# Altium schematic sheet Soc_SmartFusion2.SchDoc
size A1; SheetNumber: 2; SheetTotal: 9
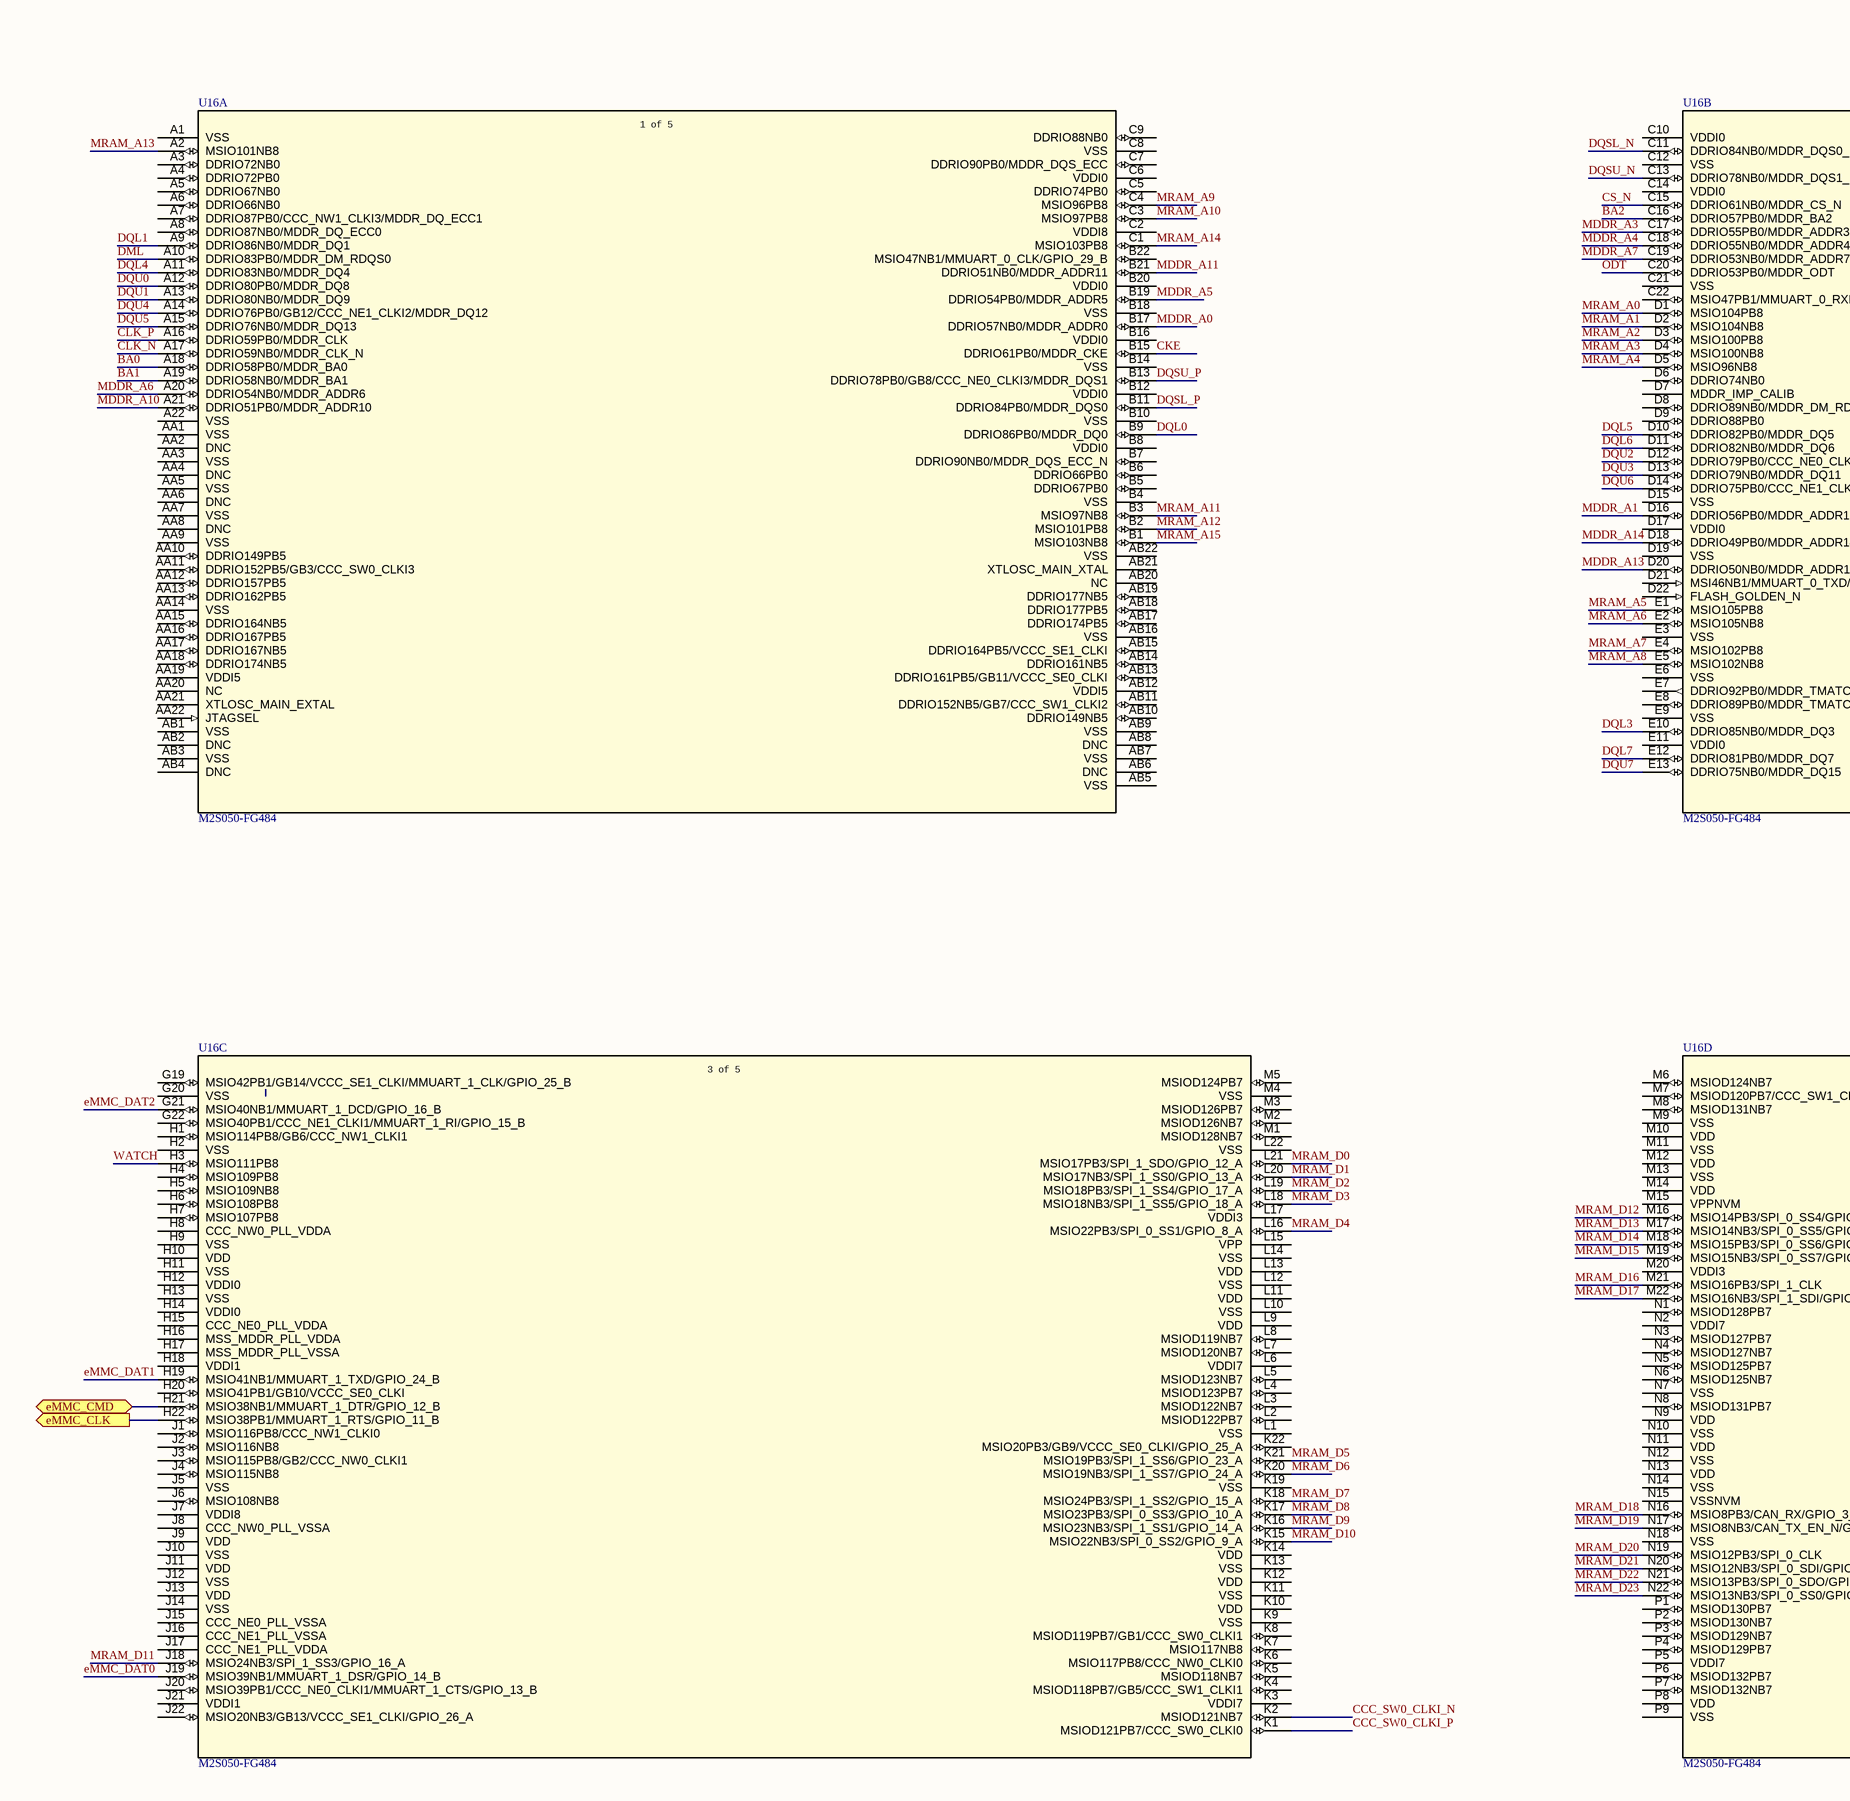
[diagram p0: Soc_SmartFusion2.SchDoc, top left]
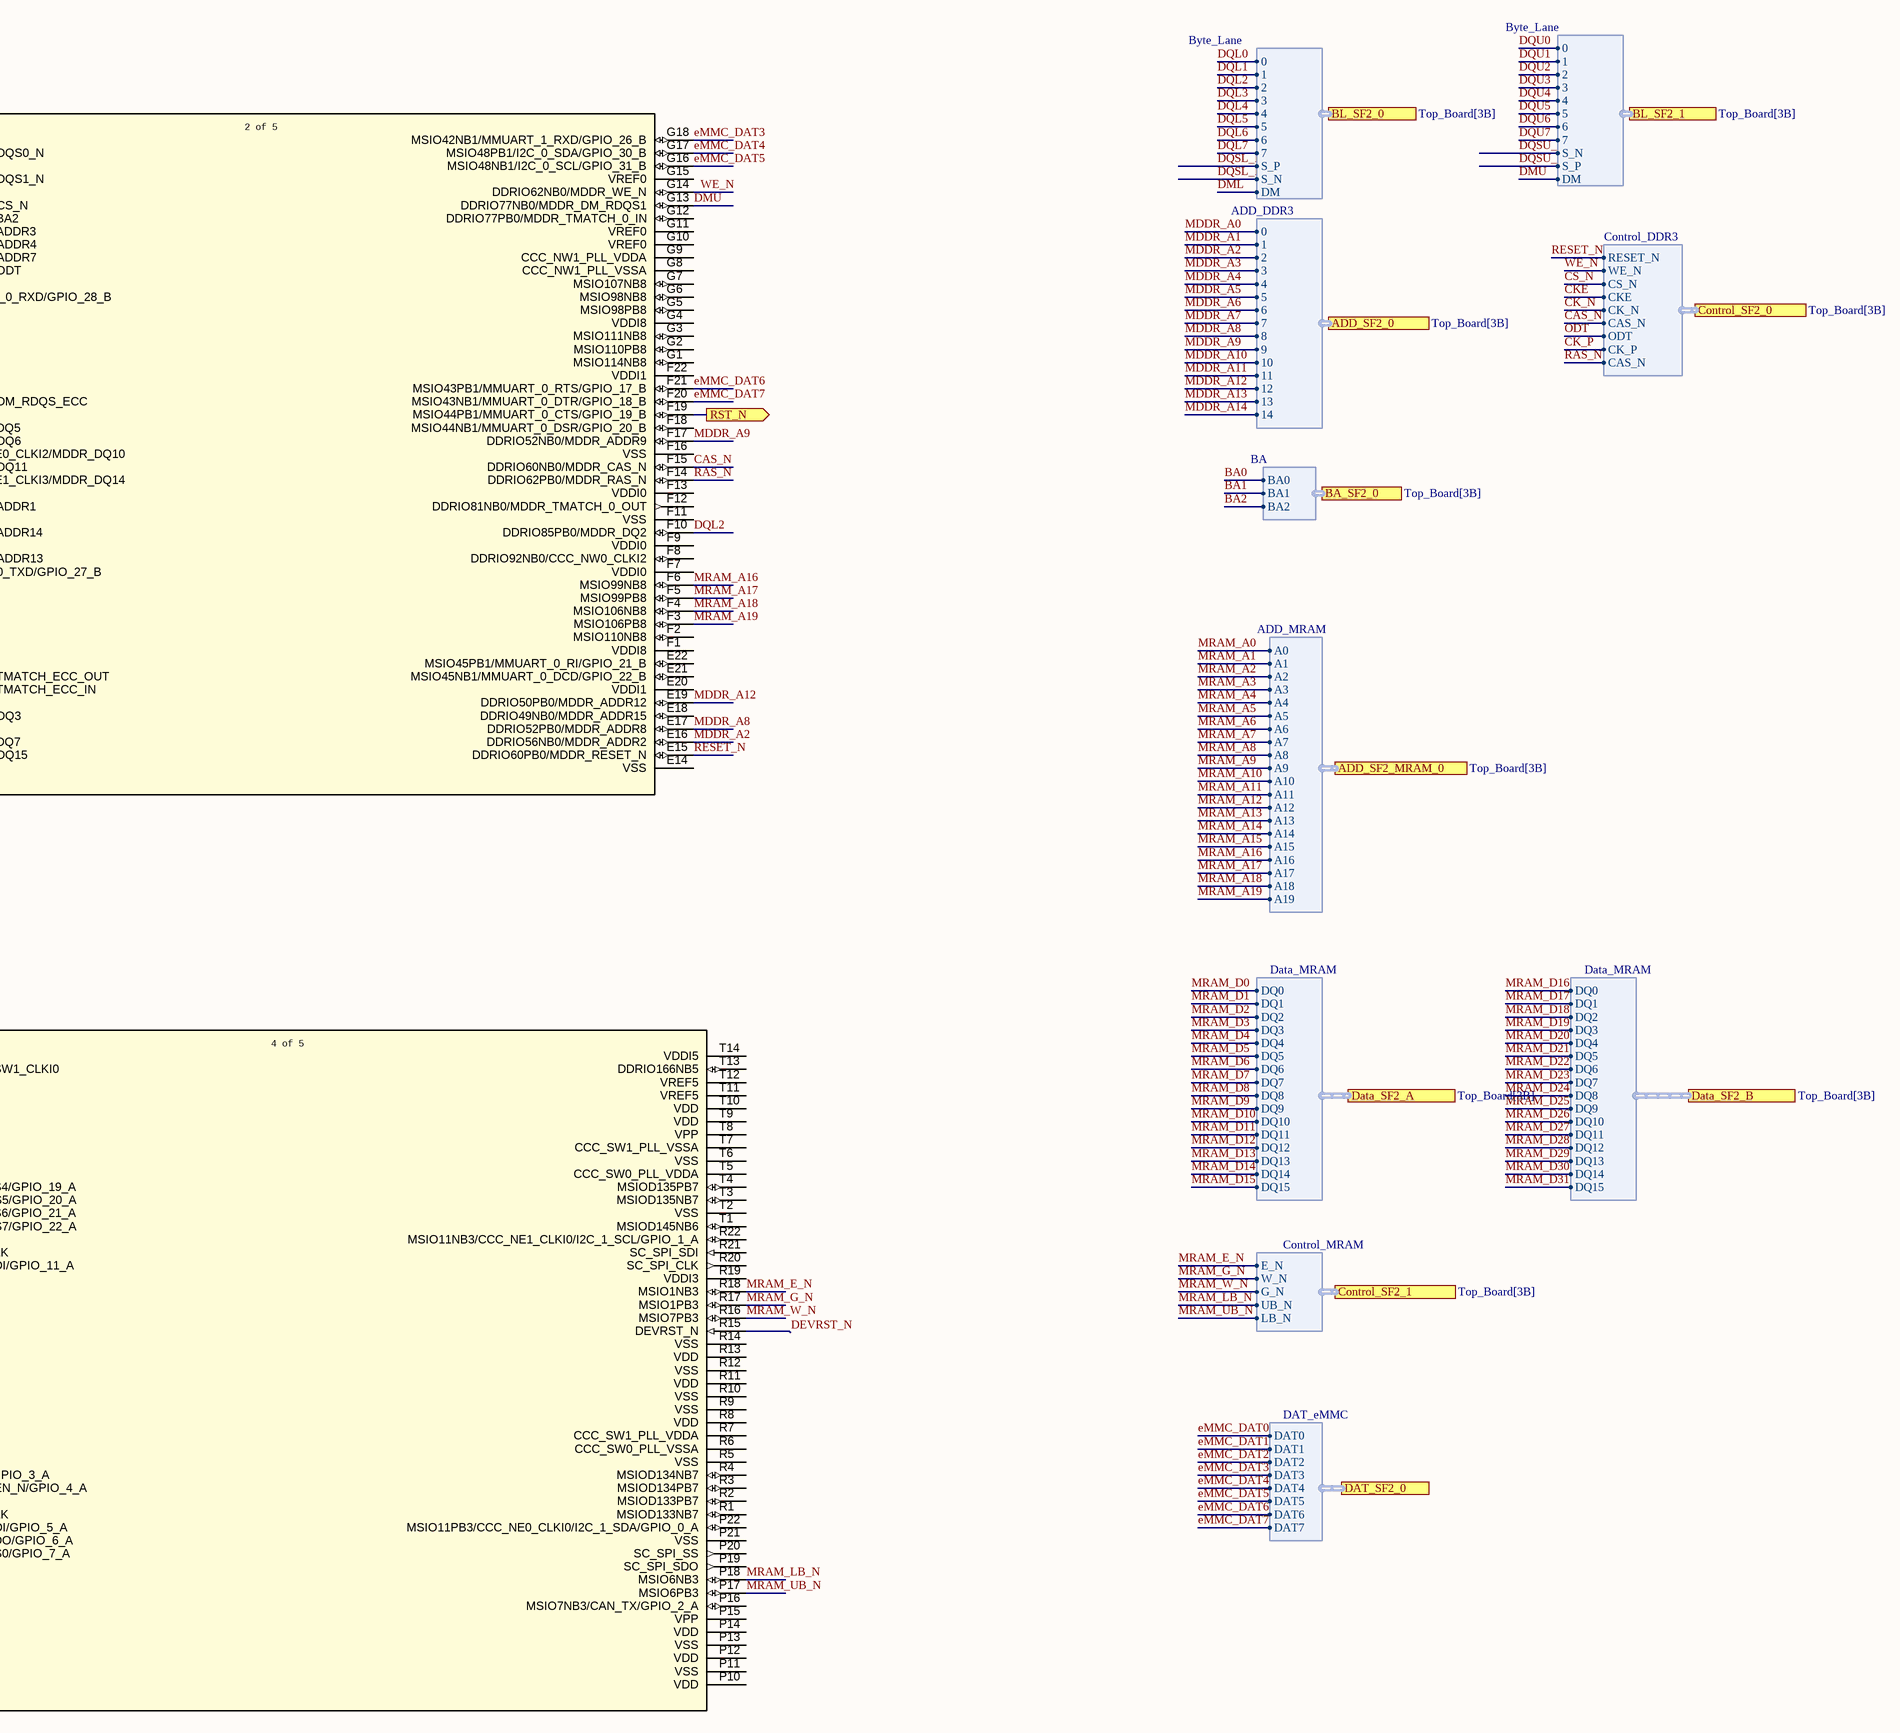
[diagram p1: Soc_SmartFusion2.SchDoc, top right]
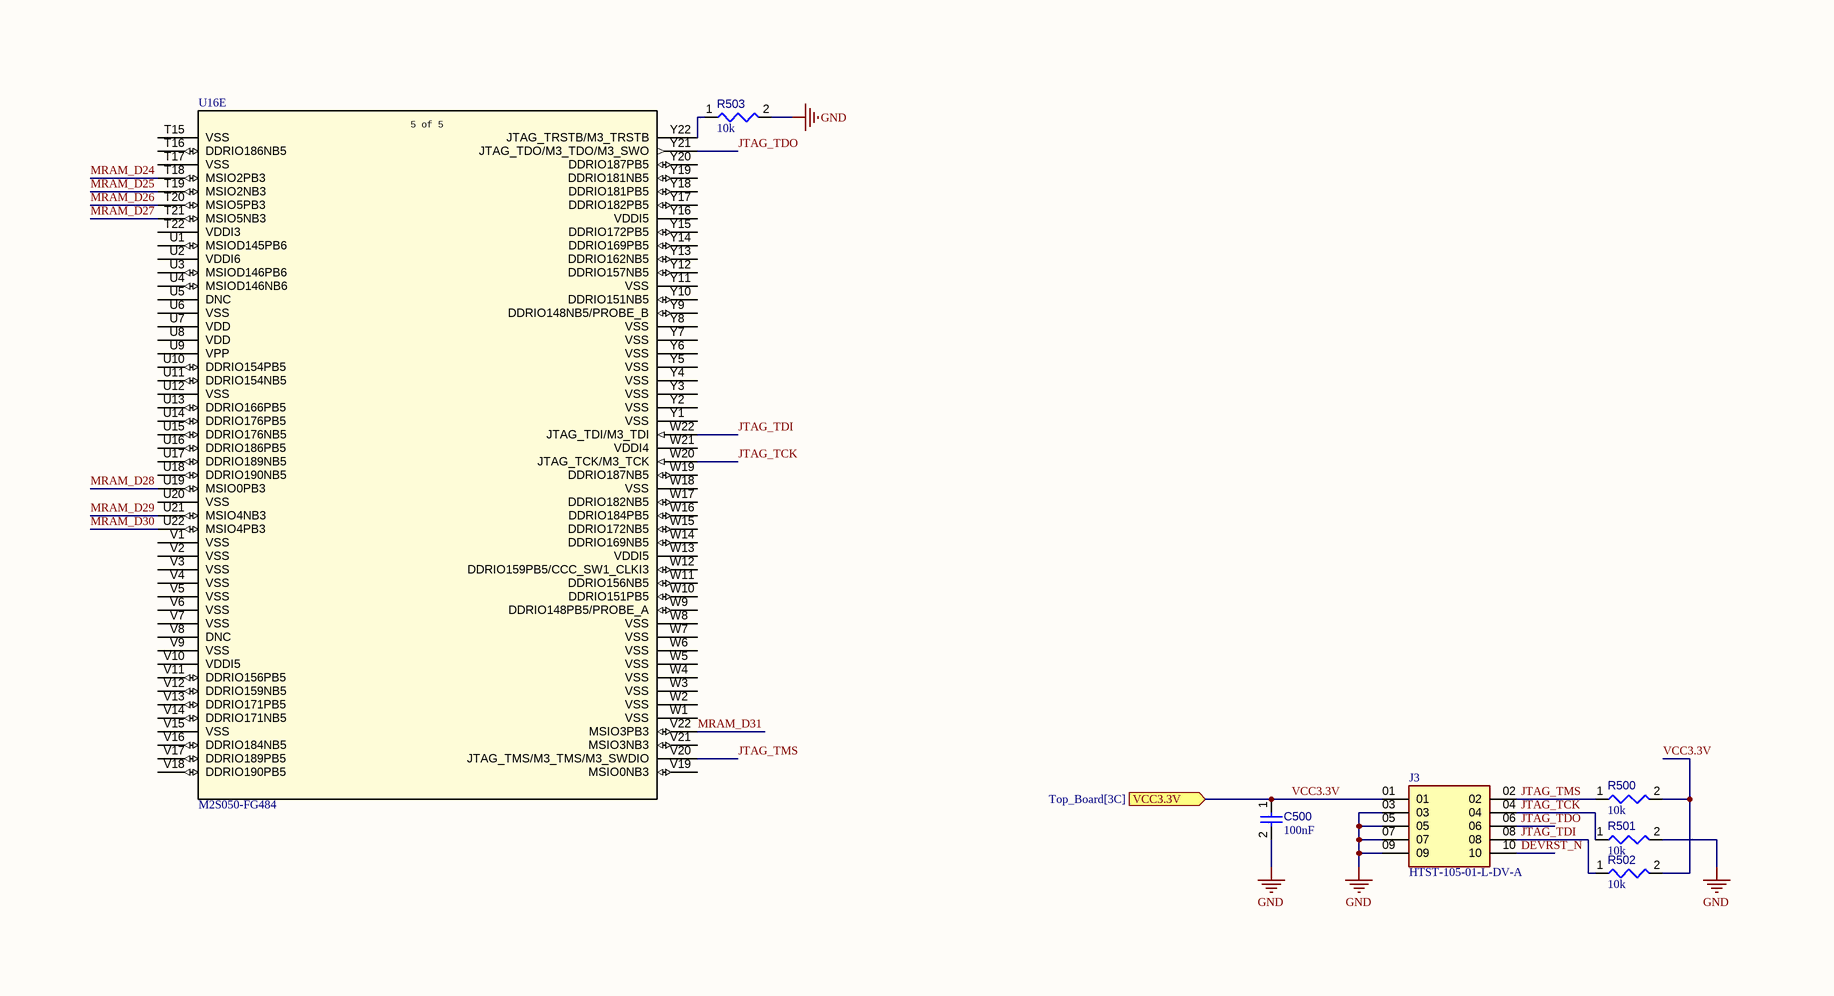
[diagram p2: Soc_SmartFusion2.SchDoc, bottom left]
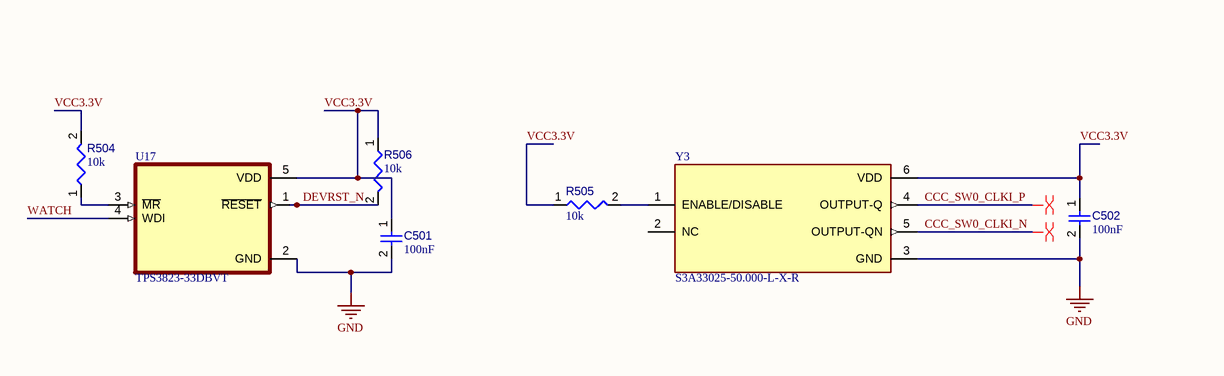
[diagram p3: Soc_SmartFusion2.SchDoc, bottom right]

## Parts
C500  value 100nF  [CAPC1608X90X40NL10T20]  (hidden comment: Capacitor 100 nF +/-10% 50 V 0603)
C501  value 100nF  [CAPC1608X90X40NL10T20]  (hidden comment: Capacitor 100 nF +/-10% 50 V 0603)
C502  value 100nF  [CAPC1608X90X40NL10T20]  (hidden comment: Capacitor 100 nF +/-10% 50 V 0603)
J3  HTST-105-01-L-DV-A  [SAMTEC_HTST-105-01-L-DV-A]
R500  value 10k  [RESC1608X55X25ML10T15]  (hidden comment: Resistor 10k +/-1% 0603 100 mW)
R501  value 10k  [RESC1608X55X25ML10T15]  (hidden comment: Resistor 10k +/-1% 0603 100 mW)
R502  value 10k  [RESC1608X55X25ML10T15]  (hidden comment: Resistor 10k +/-1% 0603 100 mW)
R503  value 10k  [RESC1608X55X25ML10T15]  (hidden comment: Resistor 10k +/-1% 0603 100 mW)
R504  value 10k  [RESC1608X55X25ML10T15]  (hidden comment: Resistor 10k +/-1% 0603 100 mW)
R505  value 10k  [RESC1608X55X25ML10T15]  (hidden comment: Resistor 10k +/-1% 0603 100 mW)
R506  value 10k  [RESC1608X55X25ML10T15]  (hidden comment: Resistor 10k +/-1% 0603 100 mW)
U16  M2S050-FG484  [FG484_MS-034_VAR_AAJ-1_MCH]  (parts A,B,C,D,E of 5)
U17  TPS3823-33DBVT  [SOT95P280X145-5N]
Y3  S3A33025-50.000-L-X-R  [OSC_S3A33025-50.000-L-X-R]

## Ports
ADD_SF2_0 (harness ADD_DDR3, see Top_Board[3B]), ADD_SF2_MRAM_0 (harness ADD_MRAM, see Top_Board[3B]), BA_SF2_0 (harness BA, see Top_Board[3B]), BL_SF2_0 (harness Byte_Lane, see Top_Board[3B]), BL_SF2_1 (harness Byte_Lane, see Top_Board[3B]), Control_SF2_0 (harness Control_DDR3, see Top_Board[3B]), Control_SF2_1 (harness Control_MRAM, see Top_Board[3B]), DAT_SF2_0 (harness DAT_eMMC), Data_SF2_A (harness Data_MRAM, see Top_Board[3B]), Data_SF2_B (harness Data_MRAM, see Top_Board[3B]), eMMC_CLK (out), eMMC_CMD (bidir), RST_N (out), VCC3.3V (in, see Top_Board[3C])

## Harnesses
Byte_Lane: 0, 2, 3, 4, 7, 1, 6, S_P, S_N, 5, DM
Byte_Lane: 0, 1, 2, 3, 4, 5, 6, 7, S_N, S_P, DM
ADD_DDR3: 1, 2, 3, 4, 6, 5, 7, 8, 9, 11, 10, 12, 13, 0, 14
BA: BA0, BA1, BA2
Control_DDR3: RESET_N, WE_N, CS_N, CKE, CK_N, CAS_N, ODT, CK_P, CAS_N
ADD_MRAM: A0, A1, A2, A3, A4, A5, A6, A7, A8, A9, A10, A11, A12, A13, A14, A15, A16, A17, A18, A19
Data_MRAM: DQ0, DQ1, DQ2, DQ3, DQ4, DQ5, DQ6, DQ7, DQ8, DQ9, DQ10, DQ11, DQ12, DQ13, DQ14, DQ15
Control_MRAM: E_N, W_N, G_N, LB_N, UB_N
DAT_eMMC: DAT0, DAT1, DAT2, DAT3, DAT5, DAT6, DAT7, DAT4

## Nets
GND: C500.2 C501.2 C502.2 J3.03 J3.05 J3.07 J3.09 R501.2 R503.2 U17.2(GND) Y3.3(GND)
BA0: U16.A18(DDRIO58PB0/MDDR_BA0) ; port BA_SF2_0.BA0
BA1: U16.A19(DDRIO58NB0/MDDR_BA1) ; port BA_SF2_0.BA1
BA2: U16.C16(DDRIO57PB0/MDDR_BA2) ; port BA_SF2_0.BA2
CAS_N: U16.F14(DDRIO62PB0/MDDR_RAS_N) U16.F15(DDRIO60NB0/MDDR_CAS_N) ; port Control_SF2_0.CAS_N  [also labelled RAS_N]
CCC_SW0_CLKI_N: U16.K2(MSIOD121NB7) Y3.5(OUTPUT-QN)
CCC_SW0_CLKI_P: U16.K1(MSIOD121PB7/CCC_SW0_CLKI0) Y3.4(OUTPUT-Q)
CK_N: port Control_SF2_0.CK_N
CK_P: port Control_SF2_0.CK_P
CKE: U16.B15(DDRIO61PB0/MDDR_CKE) ; port Control_SF2_0.CKE
CLK_N: U16.A17(DDRIO59NB0/MDDR_CLK_N)
CLK_P: U16.A16(DDRIO59PB0/MDDR_CLK)
CS_N: U16.C15(DDRIO61NB0/MDDR_CS_N) ; port Control_SF2_0.CS_N
DEVRST_N: J3.10 R506.2 U16.R15(DEVRST_N) U17.1(~{RESET})
DML: U16.A10(DDRIO83PB0/MDDR_DM_RDQS0) ; port BL_SF2_0.DM
DMU: U16.G13(DDRIO77NB0/MDDR_DM_RDQS1) ; port BL_SF2_1.DM
DQL0: U16.B9(DDRIO86PB0/MDDR_DQ0) ; port BL_SF2_0.0
DQL1: U16.A9(DDRIO86NB0/MDDR_DQ1) ; port BL_SF2_0.1
DQL2: U16.F10(DDRIO85PB0/MDDR_DQ2) ; port BL_SF2_0.2
DQL3: U16.E10(DDRIO85NB0/MDDR_DQ3) ; port BL_SF2_0.3
DQL4: U16.A11(DDRIO83NB0/MDDR_DQ4) ; port BL_SF2_0.4
DQL5: U16.D10(DDRIO82PB0/MDDR_DQ5) ; port BL_SF2_0.5
DQL6: U16.D11(DDRIO82NB0/MDDR_DQ6) ; port BL_SF2_0.6
DQL7: U16.E12(DDRIO81PB0/MDDR_DQ7) ; port BL_SF2_0.7
DQSL_N: U16.C11(DDRIO84NB0/MDDR_DQS0_N) ; port BL_SF2_0.S_N
DQSL_P: U16.B11(DDRIO84PB0/MDDR_DQS0) ; port BL_SF2_0.S_P
DQSU_N: U16.C13(DDRIO78NB0/MDDR_DQS1_N) ; port BL_SF2_1.S_P
DQSU_P: U16.B13(DDRIO78PB0/GB8/CCC_NE0_CLKI3/MDDR_DQS1) ; port BL_SF2_1.S_N
DQU0: U16.A12(DDRIO80PB0/MDDR_DQ8) ; port BL_SF2_1.0
DQU1: U16.A13(DDRIO80NB0/MDDR_DQ9) ; port BL_SF2_1.1
DQU2: U16.D12(DDRIO79PB0/CCC_NE0_CLKI2/MDDR_DQ10) ; port BL_SF2_1.2
DQU3: U16.D13(DDRIO79NB0/MDDR_DQ11) ; port BL_SF2_1.3
DQU4: U16.A14(DDRIO76PB0/GB12/CCC_NE1_CLKI2/MDDR_DQ12) ; port BL_SF2_1.4
DQU5: U16.A15(DDRIO76NB0/MDDR_DQ13) ; port BL_SF2_1.5
DQU6: U16.D14(DDRIO75PB0/CCC_NE1_CLKI3/MDDR_DQ14) ; port BL_SF2_1.6
DQU7: U16.E13(DDRIO75NB0/MDDR_DQ15) ; port BL_SF2_1.7
eMMC_CLK: U16.H22(MSIO38PB1/MMUART_1_RTS/GPIO_11_B) ; port eMMC_CLK
eMMC_CMD: U16.H21(MSIO38NB1/MMUART_1_DTR/GPIO_12_B) ; port eMMC_CMD
eMMC_DAT0: U16.J19(MSIO39NB1/MMUART_1_DSR/GPIO_14_B) ; port DAT_SF2_0.DAT0
eMMC_DAT1: U16.H19(MSIO41NB1/MMUART_1_TXD/GPIO_24_B) ; port DAT_SF2_0.DAT1
eMMC_DAT2: U16.G21(MSIO40NB1/MMUART_1_DCD/GPIO_16_B) ; port DAT_SF2_0.DAT2
eMMC_DAT3: U16.G18(MSIO42NB1/MMUART_1_RXD/GPIO_26_B) ; port DAT_SF2_0.DAT3
eMMC_DAT4: U16.G17(MSIO48PB1/I2C_0_SDA/GPIO_30_B) ; port DAT_SF2_0.DAT4
eMMC_DAT5: U16.G16(MSIO48NB1/I2C_0_SCL/GPIO_31_B) ; port DAT_SF2_0.DAT5
eMMC_DAT6: U16.F21(MSIO43PB1/MMUART_0_RTS/GPIO_17_B) ; port DAT_SF2_0.DAT6
eMMC_DAT7: U16.F20(MSIO43NB1/MMUART_0_DTR/GPIO_18_B) ; port DAT_SF2_0.DAT7
JTAG_TCK: J3.04 R501.1 U16.W20(JTAG_TCK/M3_TCK)
JTAG_TDI: J3.08 R502.1 U16.W22(JTAG_TDI/M3_TDI)
JTAG_TDO: J3.06 U16.Y21(JTAG_TDO/M3_TDO/M3_SWO)
JTAG_TMS: J3.02 R500.1 U16.V20(JTAG_TMS/M3_TMS/M3_SWDIO)
MDDR_A0: U16.B17(DDRIO57NB0/MDDR_ADDR0) ; port ADD_SF2_0.0
MDDR_A1: U16.D16(DDRIO56PB0/MDDR_ADDR1) ; port ADD_SF2_0.1
MDDR_A2: U16.E16(DDRIO56NB0/MDDR_ADDR2) ; port ADD_SF2_0.2
MDDR_A3: U16.C17(DDRIO55PB0/MDDR_ADDR3) ; port ADD_SF2_0.3
MDDR_A4: U16.C18(DDRIO55NB0/MDDR_ADDR4) ; port ADD_SF2_0.4
MDDR_A5: U16.B19(DDRIO54PB0/MDDR_ADDR5) ; port ADD_SF2_0.5
MDDR_A6: U16.A20(DDRIO54NB0/MDDR_ADDR6) ; port ADD_SF2_0.6
MDDR_A7: U16.C19(DDRIO53NB0/MDDR_ADDR7) ; port ADD_SF2_0.7
MDDR_A8: U16.E17(DDRIO52PB0/MDDR_ADDR8) ; port ADD_SF2_0.8
MDDR_A9: U16.F17(DDRIO52NB0/MDDR_ADDR9) ; port ADD_SF2_0.9
MDDR_A10: U16.A21(DDRIO51PB0/MDDR_ADDR10) ; port ADD_SF2_0.10
MDDR_A11: U16.B21(DDRIO51NB0/MDDR_ADDR11) ; port ADD_SF2_0.11
MDDR_A12: U16.E19(DDRIO50PB0/MDDR_ADDR12) ; port ADD_SF2_0.12
MDDR_A13: U16.D20(DDRIO50NB0/MDDR_ADDR13) ; port ADD_SF2_0.13
MDDR_A14: U16.D18(DDRIO49PB0/MDDR_ADDR14) ; port ADD_SF2_0.14
MRAM_A0: U16.D1(MSIO104PB8) ; port ADD_SF2_MRAM_0.A0
MRAM_A1: U16.D2(MSIO104NB8) ; port ADD_SF2_MRAM_0.A1
MRAM_A2: U16.D3(MSIO100PB8) ; port ADD_SF2_MRAM_0.A2
MRAM_A3: U16.D4(MSIO100NB8) ; port ADD_SF2_MRAM_0.A3
MRAM_A4: U16.D5(MSIO96NB8) ; port ADD_SF2_MRAM_0.A4
MRAM_A5: U16.E1(MSIO105PB8) ; port ADD_SF2_MRAM_0.A5
MRAM_A6: U16.E2(MSIO105NB8) ; port ADD_SF2_MRAM_0.A6
MRAM_A7: U16.E4(MSIO102PB8) ; port ADD_SF2_MRAM_0.A7
MRAM_A8: U16.E5(MSIO102NB8) ; port ADD_SF2_MRAM_0.A8
MRAM_A9: U16.C4(MSIO96PB8) ; port ADD_SF2_MRAM_0.A9
MRAM_A10: U16.C3(MSIO97PB8) ; port ADD_SF2_MRAM_0.A10
MRAM_A11: U16.B3(MSIO97NB8) ; port ADD_SF2_MRAM_0.A11
MRAM_A12: U16.B2(MSIO101PB8) ; port ADD_SF2_MRAM_0.A12
MRAM_A13: U16.A2(MSIO101NB8) ; port ADD_SF2_MRAM_0.A13
MRAM_A14: U16.C1(MSIO103PB8) ; port ADD_SF2_MRAM_0.A14
MRAM_A15: U16.B1(MSIO103NB8) ; port ADD_SF2_MRAM_0.A15
MRAM_A16: U16.F6(MSIO99NB8) ; port ADD_SF2_MRAM_0.A16
MRAM_A17: U16.F5(MSIO99PB8) ; port ADD_SF2_MRAM_0.A17
MRAM_A18: U16.F4(MSIO106NB8) ; port ADD_SF2_MRAM_0.A18
MRAM_A19: U16.F3(MSIO106PB8) ; port ADD_SF2_MRAM_0.A19
MRAM_D0: U16.L21(MSIO17PB3/SPI_1_SDO/GPIO_12_A) ; port Data_SF2_A.DQ0
MRAM_D1: U16.L20(MSIO17NB3/SPI_1_SS0/GPIO_13_A) ; port Data_SF2_A.DQ1
MRAM_D2: U16.L19(MSIO18PB3/SPI_1_SS4/GPIO_17_A) ; port Data_SF2_A.DQ2
MRAM_D3: U16.L18(MSIO18NB3/SPI_1_SS5/GPIO_18_A) ; port Data_SF2_A.DQ3
MRAM_D4: U16.L16(MSIO22PB3/SPI_0_SS1/GPIO_8_A) ; port Data_SF2_A.DQ4
MRAM_D5: U16.K21(MSIO19PB3/SPI_1_SS6/GPIO_23_A) ; port Data_SF2_A.DQ5
MRAM_D6: U16.K20(MSIO19NB3/SPI_1_SS7/GPIO_24_A) ; port Data_SF2_A.DQ6
MRAM_D7: U16.K18(MSIO24PB3/SPI_1_SS2/GPIO_15_A) ; port Data_SF2_A.DQ7
MRAM_D8: U16.K17(MSIO23PB3/SPI_0_SS3/GPIO_10_A) ; port Data_SF2_A.DQ8
MRAM_D9: U16.K16(MSIO23NB3/SPI_1_SS1/GPIO_14_A) ; port Data_SF2_A.DQ9
MRAM_D10: U16.K15(MSIO22NB3/SPI_0_SS2/GPIO_9_A) ; port Data_SF2_A.DQ10
MRAM_D11: U16.J18(MSIO24NB3/SPI_1_SS3/GPIO_16_A) ; port Data_SF2_A.DQ11
MRAM_D12: U16.M16(MSIO14PB3/SPI_0_SS4/GPIO_19_A) ; port Data_SF2_A.DQ12
MRAM_D13: U16.M17(MSIO14NB3/SPI_0_SS5/GPIO_20_A) ; port Data_SF2_A.DQ13
MRAM_D14: U16.M18(MSIO15PB3/SPI_0_SS6/GPIO_21_A) ; port Data_SF2_A.DQ14
MRAM_D15: U16.M19(MSIO15NB3/SPI_0_SS7/GPIO_22_A) ; port Data_SF2_A.DQ15
MRAM_D16: U16.M21(MSIO16PB3/SPI_1_CLK) ; port Data_SF2_B.DQ0
MRAM_D17: U16.M22(MSIO16NB3/SPI_1_SDI/GPIO_11_A) ; port Data_SF2_B.DQ1
MRAM_D18: U16.N16(MSIO8PB3/CAN_RX/GPIO_3_A) ; port Data_SF2_B.DQ2
MRAM_D19: U16.N17(MSIO8NB3/CAN_TX_EN_N/GPIO_4_A) ; port Data_SF2_B.DQ3
MRAM_D20: U16.N19(MSIO12PB3/SPI_0_CLK) ; port Data_SF2_B.DQ4
MRAM_D21: U16.N20(MSIO12NB3/SPI_0_SDI/GPIO_5_A) ; port Data_SF2_B.DQ5
MRAM_D22: U16.N21(MSIO13PB3/SPI_0_SDO/GPIO_6_A) ; port Data_SF2_B.DQ6
MRAM_D23: U16.N22(MSIO13NB3/SPI_0_SS0/GPIO_7_A) ; port Data_SF2_B.DQ7
MRAM_D24: U16.T18(MSIO2PB3) ; port Data_SF2_B.DQ8
MRAM_D25: U16.T19(MSIO2NB3) ; port Data_SF2_B.DQ9
MRAM_D26: U16.T20(MSIO5PB3) ; port Data_SF2_B.DQ10
MRAM_D27: U16.T21(MSIO5NB3) ; port Data_SF2_B.DQ11
MRAM_D28: U16.U19(MSIO0PB3) ; port Data_SF2_B.DQ12
MRAM_D29: U16.U21(MSIO4NB3) ; port Data_SF2_B.DQ13
MRAM_D30: U16.U22(MSIO4PB3) ; port Data_SF2_B.DQ14
MRAM_D31: U16.V22(MSIO3PB3) ; port Data_SF2_B.DQ15
MRAM_E_N: U16.R18(MSIO1NB3) ; port Control_SF2_1.E_N
MRAM_G_N: U16.R17(MSIO1PB3) ; port Control_SF2_1.W_N
MRAM_LB_N: U16.P18(MSIO6NB3) ; port Control_SF2_1.UB_N
MRAM_UB_N: U16.P17(MSIO6PB3) ; port Control_SF2_1.LB_N
MRAM_W_N: U16.R16(MSIO7PB3) ; port Control_SF2_1.G_N
ODT: U16.C20(DDRIO53PB0/MDDR_ODT) ; port Control_SF2_0.ODT
RESET_N: U16.E15(DDRIO60PB0/MDDR_RESET_N) ; port Control_SF2_0.RESET_N
RST_N: U16.F19(MSIO44PB1/MMUART_0_CTS/GPIO_19_B) ; port RST_N
VCC3.3V: C500.1 C501.1 C502.1 J3.01 R500.2 R502.2 R504.2 R505.1 R506.1 U17.5(VDD) Y3.6(VDD) ; port VCC3.3V
WATCH: U16.H3(MSIO111PB8) U17.4(WDI)
WE_N: U16.G14(DDRIO62NB0/MDDR_WE_N) ; port Control_SF2_0.WE_N
NetR503_1: R503.1 U16.Y22(JTAG_TRSTB/M3_TRSTB)
NetR504_1: R504.1 U17.3(~{MR})
NetR505_2: R505.2 Y3.1(ENABLE/DISABLE)

Not connected (* = marked no-connect by the designer): U16 A1(VSS) A3(DDRIO72NB0) A4(DDRIO72PB0) A5(DDRIO67NB0) A6(DDRIO66NB0) A7(DDRIO87PB0/CCC_NW1_CLKI3/MDDR_DQ_ECC1) A8(DDRIO87NB0/MDDR_DQ_ECC0) A22(VSS) AA1(VSS) AA2(DNC) AA3(VSS) AA4(DNC) AA5(VSS) AA6(DNC) AA7(VSS) AA8(DNC) AA9(VSS) AA10(DDRIO149PB5) AA11(DDRIO152PB5/GB3/CCC_SW0_CLKI3) AA12(DDRIO157PB5) AA13(DDRIO162PB5) AA14(VSS) AA15(DDRIO164NB5) AA16(DDRIO167PB5) AA17(DDRIO167NB5) AA18(DDRIO174NB5) AA19(VDDI5) AA20(NC) AA21(XTLOSC_MAIN_EXTAL) AA22(JTAGSEL) AB1(VSS) AB2(DNC) AB3(VSS) AB4(DNC) AB5(VSS) AB6(DNC) AB7(VSS) AB8(DNC) AB9(VSS) AB10(DDRIO149NB5) AB11(DDRIO152NB5/GB7/CCC_SW1_CLKI2) AB12(VDDI5) AB13(DDRIO161PB5/GB11/VCCC_SE0_CLKI) AB14(DDRIO161NB5) AB15(DDRIO164PB5/VCCC_SE1_CLKI) AB16(VSS) AB17(DDRIO174PB5) AB18(DDRIO177PB5) AB19(DDRIO177NB5) AB20(NC) AB21(XTLOSC_MAIN_XTAL) AB22(VSS) B4(VSS) B5(DDRIO67PB0) B6(DDRIO66PB0) B7(DDRIO90NB0/MDDR_DQS_ECC_N) B8(VDDI0) B10(VSS) B12(VDDI0) B14(VSS) B16(VDDI0) B18(VSS) B20(VDDI0) B22(MSIO47NB1/MMUART_0_CLK/GPIO_29_B) C2(VDDI8) C5(DDRIO74PB0) C6(VDDI0) C7(DDRIO90PB0/MDDR_DQS_ECC) C8(VSS) C9(DDRIO88NB0) C10(VDDI0) C12(VSS) C14(VDDI0) C21(VSS) C22(MSIO47PB1/MMUART_0_RXD/GPIO_28_B) D6(DDRIO74NB0) D7(MDDR_IMP_CALIB) D8(DDRIO89NB0/MDDR_DM_RDQS_ECC) D9(DDRIO88PB0) D15(VSS) D17(VDDI0) D19(VSS) D21(MSI46NB1/MMUART_0_TXD/GPIO_27_B) D22(FLASH_GOLDEN_N) E3(VSS) E6(VSS) E7(DDRIO92PB0/MDDR_TMATCH_ECC_OUT) E8(DDRIO89PB0/MDDR_TMATCH_ECC_IN) E9(VSS) E11(VDDI0) E14(VSS) E18(DDRIO49NB0/MDDR_ADDR15) E20(VDDI1) E21(MSIO45NB1/MMUART_0_DCD/GPIO_22_B) E22(MSIO45PB1/MMUART_0_RI/GPIO_21_B) F1(VDDI8) F2(MSIO110NB8) F7(VDDI0) F8(DDRIO92NB0/CCC_NW0_CLKI2) F9(VDDI0) F11(VSS) F12(DDRIO81NB0/MDDR_TMATCH_0_OUT) F13(VDDI0) F16(VSS) F18(MSIO44NB1/MMUART_0_DSR/GPIO_20_B) F22(VDDI1) G1(MSIO114NB8) G2(MSIO110PB8) G3(MSIO111NB8) G4(VDDI8) G5(MSIO98PB8) G6(MSIO98NB8) G7(MSIO107NB8) G8(CCC_NW1_PLL_VSSA) G9(CCC_NW1_PLL_VDDA) G10(VREF0) G11(VREF0) G12(DDRIO77PB0/MDDR_TMATCH_0_IN) G15(VREF0) G19(MSIO42PB1/GB14/VCCC_SE1_CLKI/MMUART_1_CLK/GPIO_25_B) G20(VSS) G22(MSIO40PB1/CCC_NE1_CLKI1/MMUART_1_RI/GPIO_15_B) H1(MSIO114PB8/GB6/CCC_NW1_CLKI1) H2(VSS) H4(MSIO109PB8) H5(MSIO109NB8) H6(MSIO108PB8) H7(MSIO107PB8) H8(CCC_NW0_PLL_VDDA) H9(VSS) H10(VDD) H11(VSS) H12(VDDI0) H13(VSS) H14(VDDI0) H15(CCC_NE0_PLL_VDDA) H16(MSS_MDDR_PLL_VDDA) H17(MSS_MDDR_PLL_VSSA) H18(VDDI1) H20(MSIO41PB1/GB10/VCCC_SE0_CLKI) J1(MSIO116PB8/CCC_NW1_CLKI0) J2(MSIO116NB8) J3(MSIO115PB8/GB2/CCC_NW0_CLKI1) J4(MSIO115NB8) J5(VSS) J6(MSIO108NB8) J7(VDDI8) J8(CCC_NW0_PLL_VSSA) J9(VDD) J10(VSS) J11(VDD) J12(VSS) J13(VDD) J14(VSS) J15(CCC_NE0_PLL_VSSA) J16(CCC_NE1_PLL_VSSA) J17(CCC_NE1_PLL_VDDA) J20(MSIO39PB1/CCC_NE0_CLKI1/MMUART_1_CTS/GPIO_13_B) J21(VDDI1) J22(MSIO20NB3/GB13/VCCC_SE1_CLKI/GPIO_26_A) K3(VDDI7) K4(MSIOD118PB7/GB5/CCC_SW1_CLKI1) K5(MSIOD118NB7) K6(MSIO117PB8/CCC_NW0_CLKI0) K7(MSIO117NB8) K8(MSIOD119PB7/GB1/CCC_SW0_CLKI1) K9(VSS) K10(VDD) K11(VSS) K12(VDD) K13(VSS) K14(VDD) K19(VSS) K22(MSIO20PB3/GB9/VCCC_SE0_CLKI/GPIO_25_A) L1(VSS) L2(MSIOD122PB7) L3(MSIOD122NB7) L4(MSIOD123PB7) L5(MSIOD123NB7) L6(VDDI7) L7(MSIOD120NB7) L8(MSIOD119NB7) L9(VDD) L10(VSS) L11(VDD) L12(VSS) L13(VDD) L14(VSS) L15(VPP) L17(VDDI3) L22(VSS) M1(MSIOD128NB7) M2(MSIOD126NB7) M3(MSIOD126PB7) M4(VSS) M5(MSIOD124PB7) M6(MSIOD124NB7) M7(MSIOD120PB7/CCC_SW1_CLKI0) M8(MSIOD131NB7) M9(VSS) M10(VDD) M11(VSS) M12(VDD) M13(VSS) M14(VDD) M15(VPPNVM) M20(VDDI3) N1(MSIOD128PB7) N2(VDDI7) N3(MSIOD127PB7) N4(MSIOD127NB7) N5(MSIOD125PB7) N6(MSIOD125NB7) N7(VSS) N8(MSIOD131PB7) N9(VDD) N10(VSS) N11(VDD) N12(VSS) N13(VDD) N14(VSS) N15(VSSNVM) N18(VSS) P1(MSIOD130PB7) P2(MSIOD130NB7) P3(MSIOD129NB7) P4(MSIOD129PB7) P5(VDDI7) P6(MSIOD132PB7) P7(MSIOD132NB7) P8(VDD) P9(VSS) P10(VDD) P11(VSS) P12(VDD) P13(VSS) P14(VDD) P15(VPP) P16(MSIO7NB3/CAN_TX/GPIO_2_A) P19(SC_SPI_SDO) P20(SC_SPI_SS) P21(VSS) P22(MSIO11PB3/CCC_NE0_CLKI0/I2C_1_SDA/GPIO_0_A) R1(MSIOD133NB7) R2(MSIOD133PB7) R3(MSIOD134PB7) R4(MSIOD134NB7) R5(VSS) R6(CCC_SW0_PLL_VSSA) R7(CCC_SW1_PLL_VDDA) R8(VDD) R9(VSS) R10(VSS) R11(VDD) R12(VSS) R13(VDD) R14(VSS) R19(VDDI3) R20(SC_SPI_CLK) R21(SC_SPI_SDI) R22(MSIO11NB3/CCC_NE1_CLKI0/I2C_1_SCL/GPIO_1_A) T1(MSIOD145NB6) T2(VSS) T3(MSIOD135NB7) T4(MSIOD135PB7) T5(CCC_SW0_PLL_VDDA) T6(VSS) T7(CCC_SW1_PLL_VSSA) T8(VPP) T9(VDD) T10(VDD) T11(VREF5) T12(VREF5) T13(DDRIO166NB5) T14(VDDI5) T15(VSS) T16(DDRIO186NB5) T17(VSS) T22(VDDI3) U1(MSIOD145PB6) U2(VDDI6) U3(MSIOD146PB6) U4(MSIOD146NB6) U5(DNC) U6(VSS) U7(VDD) U8(VDD) U9(VPP) U10(DDRIO154PB5) U11(DDRIO154NB5) U12(VSS) U13(DDRIO166PB5) U14(DDRIO176PB5) U15(DDRIO176NB5) U16(DDRIO186PB5) U17(DDRIO189NB5) U18(DDRIO190NB5) U20(VSS) V1(VSS) V2(VSS) V3(VSS) V4(VSS) V5(VSS) V6(VSS) V7(VSS) V8(DNC) V9(VSS) V10(VDDI5) V11(DDRIO156PB5) V12(DDRIO159NB5) V13(DDRIO171PB5) V14(DDRIO171NB5) V15(VSS) V16(DDRIO184NB5) V17(DDRIO189PB5) V18(DDRIO190PB5) V19(MSIO0NB3) V21(MSIO3NB3) W1(VSS) W2(VSS) W3(VSS) W4(VSS) W5(VSS) W6(VSS) W7(VSS) W8(VSS) W9(DDRIO148PB5/PROBE_A) W10(DDRIO151PB5) W11(DDRIO156NB5) W12(DDRIO159PB5/CCC_SW1_CLKI3) W13(VDDI5) W14(DDRIO169NB5) W15(DDRIO172NB5) W16(DDRIO184PB5) W17(DDRIO182NB5) W18(VSS) W19(DDRIO187NB5) W21(VDDI4) Y1(VSS) Y2(VSS) Y3(VSS) Y4(VSS) Y5(VSS) Y6(VSS) Y7(VSS) Y8(VSS) Y9(DDRIO148NB5/PROBE_B) Y10(DDRIO151NB5) Y11(VSS) Y12(DDRIO157NB5) Y13(DDRIO162NB5) Y14(DDRIO169PB5) Y15(DDRIO172PB5) Y16(VDDI5) Y17(DDRIO182PB5) Y18(DDRIO181PB5) Y19(DDRIO181NB5) Y20(DDRIO187PB5); Y3 2(NC)

## Layout directives
differential pair: CCC_SW0_CLKI_N, CCC_SW0_CLKI_P

## Notes on the sheet
- DWG NO:
- REV:
- THIS DOCUMENT AND THE DATA DISCLOSED HEREIN OR
- HEREWITH IS THE PROPERTY OF ALTIUM LIMITED AND MAY
- BE FREELY DISTRIBUTED IN WHOLE. NO RIGHTS ARE
- RESERVED OR EXPRESS OR IMPLIED WARANTEE GIVEN.
- REVISION
- DESCRIPTION
- DATE
- APPROVED
- ENG:
- APPROVALS
- PROJECT
- DSN:
- CHK:
- REFERENCE DOCUMENTS
- PROJECT REVISION:
- TITLE
- DOCUMENT REVISION:
- DESIGN ITEM:
- BOM:
- FAB DWG:
- PCB DWG:
- ASSY DWG:
- SCALE:
- A2
- SIZE
- CAGE CODE
- FILE NAME
- DWG NO.
- SHEET
- OF
- REV
- (in symbol CMP-018-000000-1, part A) 1 of 5
- (in symbol CMP-018-000000-1, part B) 2 of 5
- (in symbol CMP-018-000000-1, part C) 3 of 5
- (in symbol CMP-018-000000-1, part D) 4 of 5
- (in symbol CMP-018-000000-1, part E) 5 of 5

## Library data of the parts
C500-C502 = CMP-001-00017-6: Chip Capacitor, 100 nF, +/- 10%, 50 V, 0603 (1608 Metric); Voltage Rating: 50V; Capacitor Type: Ceramic; Tolerance: 10%; Mounting Technology: SM; Max Operating Temperature: 125°C; RoHS Compliant: True; Pins: 2; Case/Package: 0603; Min Operating Temperature: -55°C
J3 = CMP-060-000000-1: MF: Samtec Inc.; Value: *; Package: None; Source: HTST-105-01-L-DV-A.SchLib; Price: None; MP: HTST-105-01-L-DV-A; Component Type: Standard; Pin Count: 10; Availability: Unavailable; Design Item ID: HTST-105-01-L-DV-A
R500-R506 = CMP-009-00017-5: Chip Resistor, 10 KOhm, +/- 1%, 01 W, -55 to 155 degC, 0603 (1608 Metric); Voltage Rating: 50V; Power: 100mW; RoHS Compliant: True; Min Operating Temperature: -55°C; Pins: 2; Case/Package: 0603; Mounting Technology: SM; Max Operating Temperature: 155°C; Tolerance: 1%
U16 = CMP-018-000000-1: Description; Manufacturer_Name: Microchip; Design Item ID: M2S050-FG484; RefDes: RefDes; Copyright: Copyright (C) 2025 Ultra Librarian. All rights reserved.; Type: Embedded; Manufacturer_Part_Number: M2S050-FG484; Source: M2S050-FG484.SchLib
U17 = CMP-031-00006-1: Active-low, push-pull, voltage supervisor (reset IC) with 1.6-s watchdog & manual reset; MF: Texas Instruments; Case/Package: SOT-23-5 Texas Instruments; Value: *; SnapEDA_Link: https://www.snapeda.com/parts/TPS3823-33DBVT/Texas+Instruments/view-part/?ref=snap; Pins: 5; Check_prices: https://www.snapeda.com/parts/TPS3823-33DBVT/Texas+Instruments/view-part/?ref=eda; MP: TPS3823-33DBVT; Source: TPS3823-33DBVT.SchLib; Design Item ID: TPS3823-33DBVT; Component Type: Standard; Component Type: Integrated Circuits
Y3 = CMP-030-000000-1: Component Type: Standard; Source: S3A33025-50.000-L-X-R.SchLib; MP: S3A33025-50.000-L-X-R; Value: *; Pin Count: 6; Design Item ID: S3A33025-50.000-L-X-R; Package: None; Price: None; Availability: Unavailable